# Altium schematic sheet EDA扩展板V3.0.SchDoc
size A2
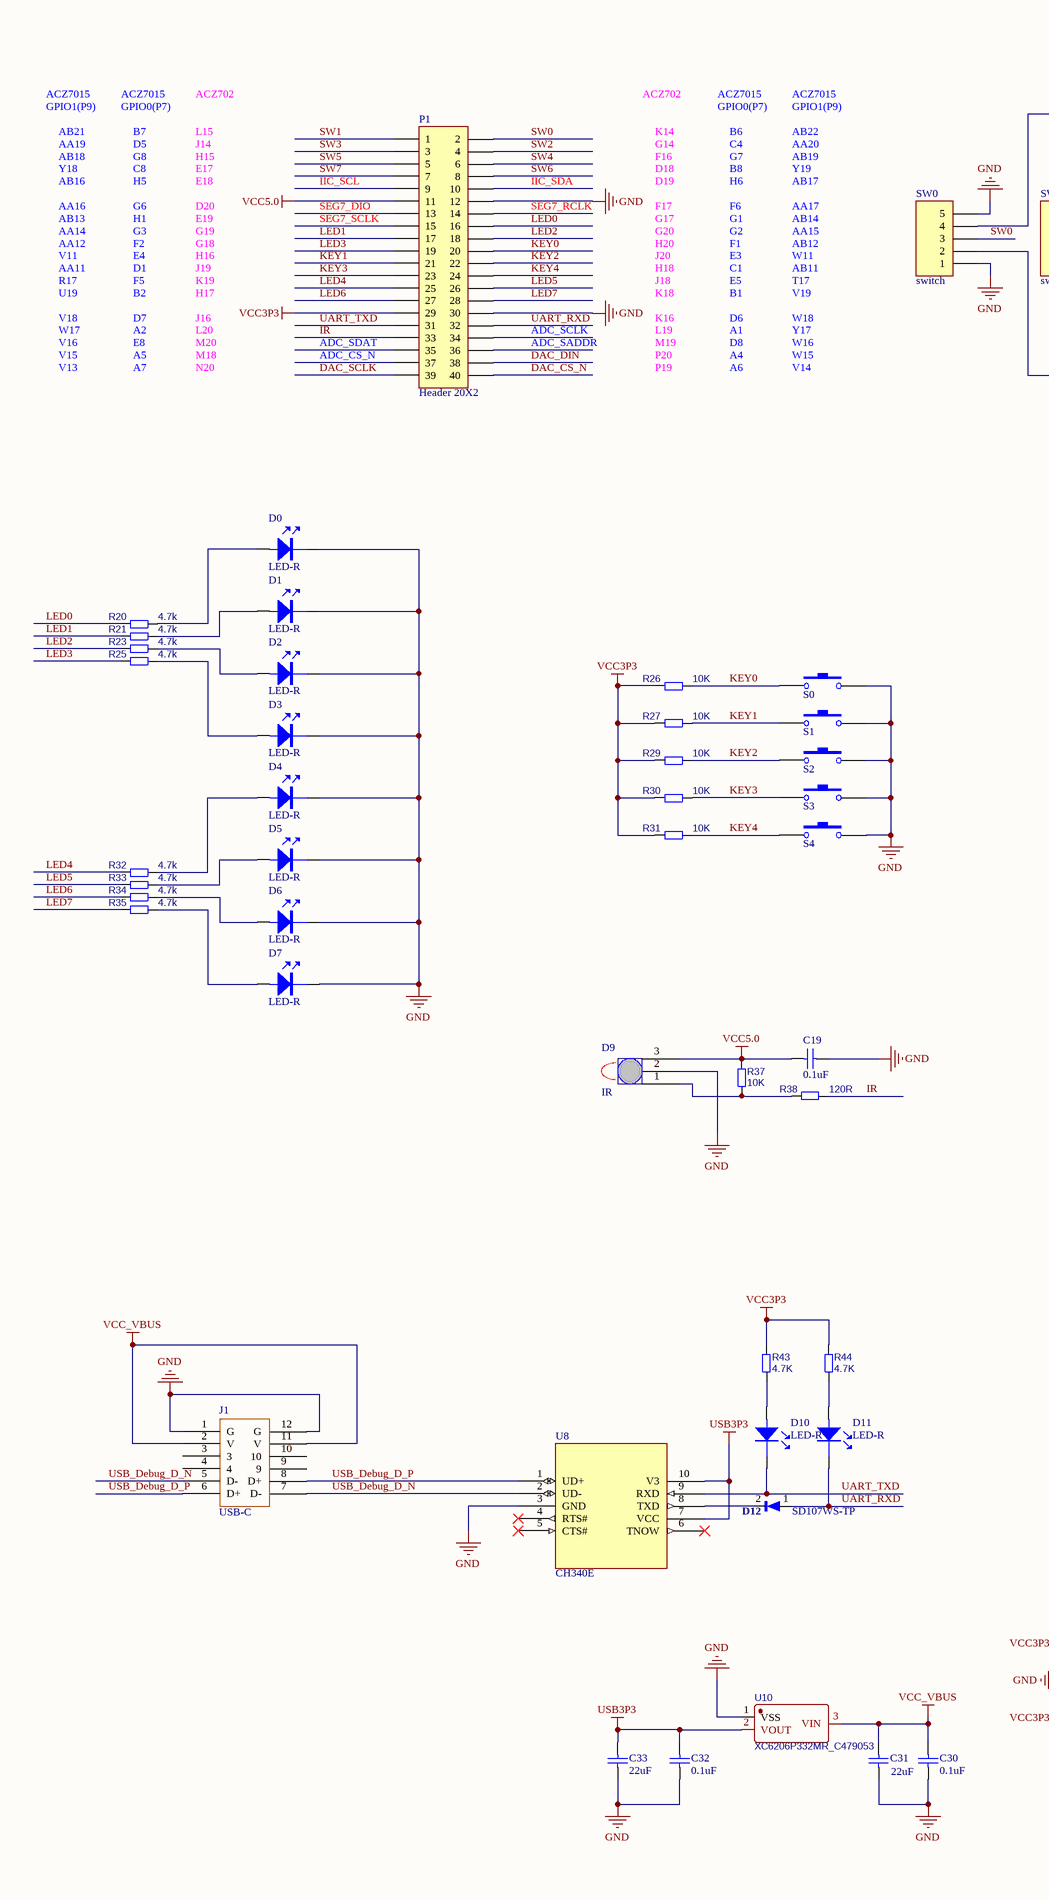
[diagram p0: EDA扩展板V3.0.SchDoc, left]
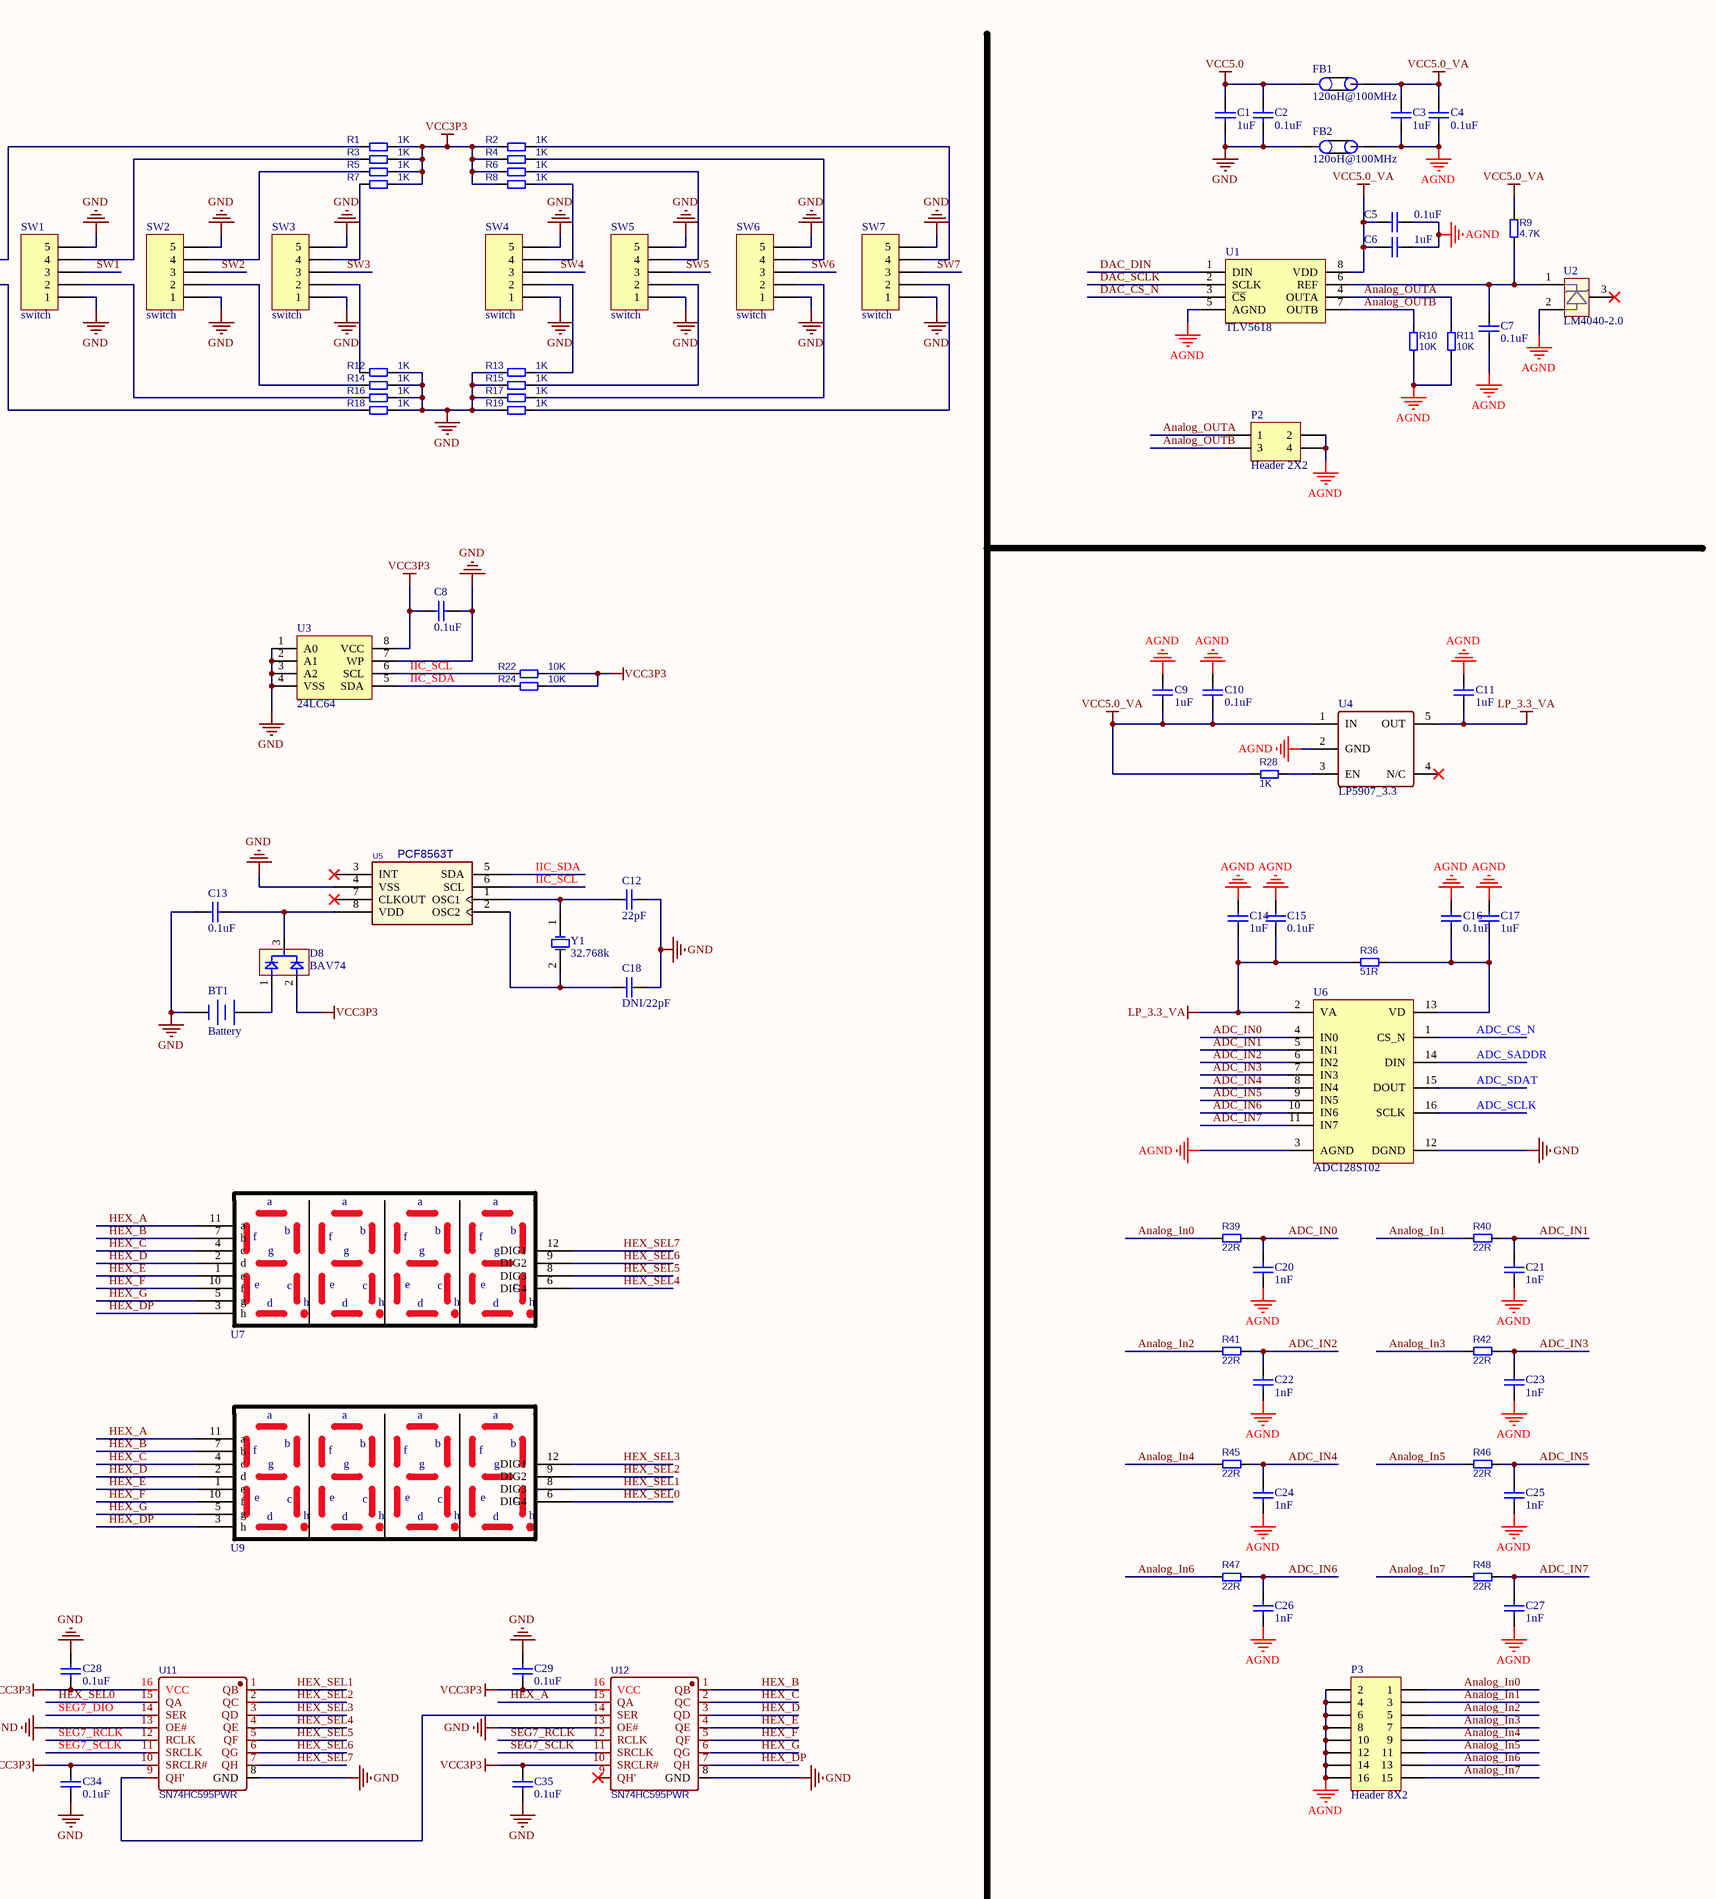
[diagram p1: EDA扩展板V3.0.SchDoc, right]

## Parts
BT1  Battery  [CR1220贴片电池座]
C1  1uF  [C0603]
C2  0.1uF  [C0603]
C3  1uF  [C0603]
C4  0.1uF  [C0603]
C5  0.1uF  [C0603]
C6  1uF  [C0603]
C7  0.1uF  [C0603]
C8  0.1uF  [C0603]
C9  1uF  [C0603]
C10  0.1uF  [C0603]
C11  1uF  [C0603]
C12  22pF  [C0603]
C13  0.1uF  [C0603]
C14  1uF  [C0603]
C15  0.1uF  [C0603]
C16  0.1uF  [C0603]
C17  1uF  [C0603]
C18  DNI/22pF  [C0603]
C19  0.1uF  [C0603]
C20  1nF  [C0603]
C21  1nF  [C0603]
C22  1nF  [C0603]
C23  1nF  [C0603]
C24  1nF  [C0603]
C25  1nF  [C0603]
C26  1nF  [C0603]
C27  1nF  [C0603]
C28  0.1uF  [C0603]
C29  0.1uF  [C0603]
C30  0.1uF  [C0603]
C31  22uF  [C0603]
C32  0.1uF  [C0603]
C33  22uF  [C0603]
C34  0.1uF  [C0603]
C35  0.1uF  [C0603]
D0  LED-R  [0603 LED]
D1  LED-R  [0603 LED]
D2  LED-R  [0603 LED]
D3  LED-R  [0603 LED]
D4  LED-R  [0603 LED]
D5  LED-R  [0603 LED]
D6  LED-R  [0603 LED]
D7  LED-R  [0603 LED]
D8  value BAV74  [SOT23]  (hidden comment: DIODE-D)
D9  IR  [HS-0038 圆头红外接收管]
D10  LED-R  [0603 LED]
D11  LED-R  [0603 LED]
D12  value SD107WS-TP  [SOD323]  (hidden comment: DIODE1)
FB1  120oH@100MHz  [L0603]
FB2  120oH@100MHz  [L0603]
J1  USB-C  [USB Type-c]
P1  Header 20X2  [HDR2X20]
P2  Header 2X2  [HDR2X2]
P3  Header 8X2  [HDR2X8]
R1  1K  [0603R]
R2  1K  [0603R]
R3  1K  [0603R]
R4  1K  [0603R]
R5  1K  [0603R]
R6  1K  [0603R]
R7  1K  [0603R]
R8  1K  [0603R]
R9  4.7K  [0603R]
R10  10K  [0603R]
R11  10K  [0603R]
R12  1K  [0603R]
R13  1K  [0603R]
R14  1K  [0603R]
R15  1K  [0603R]
R16  1K  [0603R]
R17  1K  [0603R]
R18  1K  [0603R]
R19  1K  [0603R]
R20  4.7k  [0603R]
R21  4.7k  [0603R]
R22  10K  [0603R]
R23  4.7k  [0603R]
R24  10K  [0603R]
R25  4.7k  [0603R]
R26  10K  [0603R]
R27  10K  [0603R]
R28  1K  [0603R]
R29  10K  [0603R]
R30  10K  [0603R]
R31  10K  [0603R]
R32  4.7k  [0603R]
R33  4.7k  [0603R]
R34  4.7k  [0603R]
R35  4.7k  [0603R]
R36  51R  [0603R]
R37  10K  [0603R]
R38  120R  [0603R]
R39  22R  [0603R]
R40  22R  [0603R]
R41  22R  [0603R]
R42  22R  [0603R]
R43  4.7K  [0603R]
R44  4.7K  [0603R]
R45  22R  [0603R]
R46  22R  [0603R]
R47  22R  [0603R]
R48  22R  [0603R]
S0  轻触开关  [SW-PB_3_6_4_3]  (value not drawn)
S1  轻触开关  [SW-PB_3_6_4_3]  (value not drawn)
S2  轻触开关  [SW-PB_3_6_4_3]  (value not drawn)
S3  轻触开关  [SW-PB_3_6_4_3]  (value not drawn)
S4  轻触开关  [SW-PB_3_6_4_3]  (value not drawn)
SW0  switch  [SW-1 X 2]
SW1  switch  [SW-1 X 2]
SW2  switch  [SW-1 X 2]
SW3  switch  [SW-1 X 2]
SW4  switch  [SW-1 X 2]
SW5  switch  [SW-1 X 2]
SW6  switch  [SW-1 X 2]
SW7  switch  [SW-1 X 2]
U1  TLV5618  [SOP-8-1]
U2  LM4040-2.0  [SOT23]
U3  24LC64  [SOP-8-1]
U4  LP5907_3.3  [LP5907]
U5  PCF8563T  [SOP-8-1]
U6  ADC128S102  [TSSOP-16]
U7  smg_6*8  [DIG4]  (value not drawn)
U8  CH340E  [msop-10]
U9  smg_6*8  [DIG4]  (value not drawn)
U10  XC6206P332MR_C479053  [SOT-23-3_L2.9-W1.6-P1.90-LS2.8-BR]
U11  SN74HC595PWR  [TSSOP-16_L5.0-W4.4-P0.65-LS6.4-BL]
U12  SN74HC595PWR  [TSSOP-16_L5.0-W4.4-P0.65-LS6.4-BL]
Y1  32.768k  [MC-146]

## Nets
AGND: C3.1 C4.1 C5.2 C6.2 C7.1 C9.1 C10.1 C11.1 C14.1 C15.1 C16.1 C17.1 C20.1 C21.1 C22.1 C23.1 C24.1 C25.1 C26.1 C27.1 FB2.2 P2.2 P2.4 P3.2 P3.4 P3.6 P3.8 P3.10 P3.12 P3.14 P3.16 R10.2 R11.2 U1.5(AGND) U2.2 U4.2(GND) U6.3(AGND)
GND: BT1.2(-) C1.1 C2.1 C8.2 C12.2 C13.1 C18.2 C19.2 C28.2 C29.2 C30.1 C31.1 C32.1 C33.1 C34.1 C35.1 D0.2 D1.2 D2.2 D3.2 D4.2 D5.2 D6.2 D7.2 D9.2(GND) FB2.1 J1.1(G) J1.12(G) P1.12 P1.30 R12.1 R13.2 R14.1 R15.2 R16.1 R17.2 R18.1 R19.2 S0.2 S1.2 S2.2 S3.2 S4.2 SW0.1 SW0.5 SW1.1 SW1.5 SW2.1 SW2.5 SW3.1 SW3.5 SW4.1 SW4.5 SW5.1 SW5.5 SW6.1 SW6.5 SW7.1 SW7.5 U3.1(A0) U3.2(A1) U3.3(A2) U3.4(VSS) U3.7(WP) U5.4(VSS) U6.12(DGND) U8.3(GND) U10.1(VSS) U11.8(GND) U11.13(OE#) U12.8(GND) U12.13(OE#)
LP_3.3_VA: C11.2 C14.2 C15.2 R36.1 U4.5(OUT) U6.2(VA)
USB3P3: C32.2 C33.2 U8.7(VCC) U8.10(V3) U10.2(VOUT)
VCC3P3: C8.1 C28.1 C29.1 C34.2 C35.2 D8.2(D2) P1.29 R1.1 R2.2 R3.1 R4.2 R5.1 R6.2 R7.1 R8.2 R22.1 R24.1 R26.2 R27.2 R29.2 R30.2 R31.2 R43.1 R44.1 U3.8(VCC) U11.10(SRCLR#) U11.16(VCC) U12.10(SRCLR#) U12.16(VCC)
VCC5.0: C1.2 C2.2 C19.1 D9.3(D) FB1.1 P1.11 R37.1
VCC5.0_VA: C3.2 C4.2 C5.1 C6.1 C9.2 C10.2 FB1.2 R9.1 R28.1 U1.8(VDD) U4.1(IN)
VCC_VBUS: C30.2 C31.2 J1.2(V) J1.11(V) U10.3(VIN)
ADC_CS_N: P1.37 U6.1(CS_N)
ADC_IN0: C20.2 R39.2 U6.4(IN0)
ADC_IN1: C21.2 R40.2 U6.5(IN1)
ADC_IN2: C22.2 R41.2 U6.6(IN2)
ADC_IN3: C23.2 R42.2 U6.7(IN3)
ADC_IN4: C24.2 R45.2 U6.8(IN4)
ADC_IN5: C25.2 R46.2 U6.9(IN5)
ADC_IN6: C26.2 R47.2 U6.10(IN6)
ADC_IN7: C27.2 R48.2 U6.11(IN7)
ADC_SADDR: P1.36 U6.14(DIN)
ADC_SCLK: P1.34 U6.16(SCLK)
ADC_SDAT: P1.35 U6.15(DOUT)
Analog_In0: P3.1 R39.1
Analog_In1: P3.3 R40.1
Analog_In2: P3.5 R41.1
Analog_In3: P3.7 R42.1
Analog_In4: P3.9 R45.1
Analog_In5: P3.11 R46.1
Analog_In6: P3.13 R47.1
Analog_In7: P3.15 R48.1
Analog_OUTA: P2.1 R11.1 U1.4(OUTA)
Analog_OUTB: P2.3 R10.1 U1.7(OUTB)
DAC_CS_N: P1.40 U1.3(~{CS})
DAC_DIN: P1.38 U1.1(DIN)
DAC_SCLK: P1.39 U1.2(SCLK)
HEX_A: U7.11(a) U9.11(a) U12.15(QA)
HEX_B: U7.7(b) U9.7(b) U12.1(QB)
HEX_C: U7.4(c) U9.4(c) U12.2(QC)
HEX_D: U7.2(d) U9.2(d) U12.3(QD)
HEX_DP: U7.3(h) U9.3(h) U12.7(QH)
HEX_E: U7.1(e) U9.1(e) U12.4(QE)
HEX_F: U7.10(f) U9.10(f) U12.5(QF)
HEX_G: U7.5(g) U9.5(g) U12.6(QG)
HEX_SEL0: U9.6(DIG4) U11.15(QA)
HEX_SEL1: U9.8(DIG3) U11.1(QB)
HEX_SEL2: U9.9(DIG2) U11.2(QC)
HEX_SEL3: U9.12(DIG1) U11.3(QD)
HEX_SEL4: U7.6(DIG4) U11.4(QE)
HEX_SEL5: U7.8(DIG3) U11.5(QF)
HEX_SEL6: U7.9(DIG2) U11.6(QG)
HEX_SEL7: U7.12(DIG1) U11.7(QH)
IIC_SCL: P1.9 R22.2 U3.6(SCL) U5.6(SCL)
IIC_SDA: P1.10 R24.2 U3.5(SDA) U5.5(SDA)
IR: P1.33 R38.2
KEY0: P1.20 R26.1 S0.1
KEY1: P1.21 R27.1 S1.1
KEY2: P1.22 R29.1 S2.1
KEY3: P1.23 R30.1 S3.1
KEY4: P1.24 R31.1 S4.1
LED0: P1.16 R20.2
LED1: P1.17 R21.2
LED2: P1.18 R23.2
LED3: P1.19 R25.2
LED4: P1.25 R32.2
LED5: P1.26 R33.2
LED6: P1.27 R34.2
LED7: P1.28 R35.2
SEG7_DIO: P1.13 U11.14(SER)
SEG7_RCLK: P1.14 U11.12(RCLK) U12.12(RCLK)
SEG7_SCLK: P1.15 U11.11(SRCLK) U12.11(SRCLK)
SW0: P1.2 SW0.3
SW1: P1.1 SW1.3
SW2: P1.4 SW2.3
SW3: P1.3 SW3.3
SW4: P1.6 SW4.3
SW5: P1.5 SW5.3
SW6: P1.8 SW6.3
SW7: P1.7 SW7.3
UART_RXD: D11.2 D12.1 P1.32
UART_TXD: D10.2 P1.31 U8.9(RXD)
USB_Debug_D_N: J1.5(D-) J1.7(D-) U8.2(UD-)
USB_Debug_D_P: J1.6(D+) J1.8(D+) U8.1(UD+)
NetBT1_1: BT1.1(+) D8.1(D1)
NetC7_2: C7.2 R9.2 U1.6(REF) U2.1(VDD)
NetC12_1: C12.1 U5.1(OSC1) Y1.1(OSC1)
NetC13_2: C13.2 D8.3(A) U5.8(VDD)
NetC16_2: C16.2 C17.2 R36.2 U6.13(VD)
NetC18_1: C18.1 U5.2(OSC2) Y1.2(OSC2)
NetD0_1: D0.1 R20.1
NetD1_1: D1.1 R21.1
NetD2_1: D2.1 R23.1
NetD3_1: D3.1 R25.1
NetD4_1: D4.1 R32.1
NetD5_1: D5.1 R33.1
NetD6_1: D6.1 R34.1
NetD7_1: D7.1 R35.1
NetD9_1: D9.1(VCC) R37.2 R38.1
NetD10_1: D10.1 R43.2
NetD11_1: D11.1 R44.2
NetD12_2: D12.2 U8.8(TXD)
NetR1_2: R1.2 SW0.4
NetR2_1: R2.1 SW7.4
NetR3_2: R3.2 SW1.4
NetR4_1: R4.1 SW6.4
NetR5_2: R5.2 SW2.4
NetR6_1: R6.1 SW5.4
NetR7_2: R7.2 SW3.4
NetR8_1: R8.1 SW4.4
NetR12_2: R12.2 SW3.2
NetR13_1: R13.1 SW4.2
NetR14_2: R14.2 SW2.2
NetR15_1: R15.1 SW5.2
NetR16_2: R16.2 SW1.2
NetR17_1: R17.1 SW6.2
NetR18_2: R18.2 SW0.2
NetR19_1: R19.1 SW7.2
NetR28_2: R28.2 U4.3(EN)
NetU11_9: U11.9(QH') U12.14(SER)

Not connected (* = marked no-connect by the designer): J1 3 4 9 10; U2 3*; U4 4(N/C)*; U5 3(INT)* 7(CLKOUT)*; U8 4(RTS#)* 5(CTS#)* 6(TNOW)*; U12 9(QH')*

## Notes on the sheet
- ACZ7015
- GPIO1(P9)
- AB21
- GPIO0(P7)
- B7
- L15
- ACZ702
- K14
- B6
- AB22
- AA19
- AB18
- Y18
- AB16
- D5
- G8
- C8
- H5
- J14
- H15
- E17
- E18
- G14
- F16
- D18
- D19
- C4
- G7
- B8
- H6
- AA20
- AB19
- Y19
- AB17
- AA16
- AB13
- AA14
- AA12
- V11
- G6
- H1
- G3
- F2
- E4
- D20
- E19
- G19
- G18
- H16
- F17
- G17
- G20
- H20
- J20
- F6
- G1
- G2
- F1
- E3
- AA17
- AB14
- AA15
- AB12
- W11
- V18
- AA11
- R17
- U19
- D7
- D1
- F5
- B2
- J19
- K19
- H17
- J16
- K16
- H18
- J18
- K18
- D6
- C1
- E5
- B1
- W18
- AB11
- T17
- V19
- W17
- V16
- V15
- V13
- A2
- E8
- A5
- A7
- L20
- M20
- M18
- N20
- L19
- M19
- P20
- P19
- A1
- D8
- A4
- A6
- Y17
- W16
- W15
- V14

## Library data of the parts
BT1 = Battery: Multicell Battery; Published: 24-Mar-1999; LatestRevisionDate: 17-Jul-2002; LatestRevisionNote: Re-released for DXP Platform.; PackageReference: BAT-2; Publisher: Altium Limited; PackageDescription: Battery; 2 Leads
C1-C35 = Cap1: Capacitor; Published: 8-Jun-2000; LatestRevisionDate: 17-Jul-2002; LatestRevisionNote: Re-released for DXP Platform.; PackageReference: RAD-0.3; Publisher: Altium Limited
  C1 C3 C6 C9 C11 C14 C17: Value: 1uF
  C2 C4 C5 C7 C8 C10 C13 C15 C16 C19 C28-C30 C32 C34 C35: Value: 0.1uF
  C12: Value: 22pF
  C18: Value: DNI/22pF
  C20-C27: Value: 1nF
  C31 C33: Value: 22uF
D0-D7 D10 D11 = LED_1: 贴片红色普亮二极管; Value: LED-R
D8 = 1.04.07.0013: BAV74,SOT-23,,RoHS; 名称: 双二极管; 设备封装名称: SOT-23_BAV74; 贴片和直插: SMT; 物料代码: 1.04.07.0013; 封装: SOT-23; RoHS: RoHS; 型号: BAV74; ComponentLink1Description: ErpDataInfo; ComponentLink1URL: http://erp.zlgmcu.com/ErpExt/ErpData/ListMateriel.aspx?pkey=1.04.07.0013
D9 = IR: 红外接收头
D12 = 1.04.07.0027_1: 1N4148,SOD-323,RoHS; 名称: 二极管; 设备封装名称: SOD-323_1N4148; 贴片和直插: SMT; 物料代码: 1.04.07.0027; 封装: SOD-323; RoHS: RoHS; 型号: 1N4148; ComponentLink1Description: ErpDataInfo; ComponentLink1URL: http://erp.zlgmcu.com/ErpExt/ErpData/ListMateriel.aspx?pkey=1.04.07.0027
FB1 FB2 = CiZhu: Value: 120oH@100MHz
J1 = USB-C-16
P1 = Header 20X2_1: IDC3-40，2.54mm，双排2*20简牛; LatestRevisionDate: 17-Jul-2002; LatestRevisionNote: Re-released for DXP Platform.; Publisher: Altium Limited
P2 = Header 2X2: Header, 2-Pin, Dual row; LatestRevisionDate: 17-Jul-2002; LatestRevisionNote: Re-released for DXP Platform.; Publisher: Altium Limited
P3 = Header 8X2: Header, 8-Pin, Dual row; LatestRevisionDate: 17-Jul-2002; LatestRevisionNote: Re-released for DXP Platform.; Publisher: Altium Limited
R1-R48 = R: Value: DNI/4K7
S0-S4 = SW-PB: Switch; Manufacturer: Generic Components; Published: 1999
SW0-SW7 = Header 5: Header, 5-Pin; LatestRevisionDate: 17-Jul-2002; LatestRevisionNote: Re-released for DXP Platform.; Publisher: Altium Limited
U2 = LM4040
U3 = 24LC256
U4 = LP5907
U5 = PCF8563: Part Number: TMP-13; ICA_PARTNUM: $$2098133$$DS1302S; ICA_MFR_NAME: MAXIM INTEGRATED PRODUCTS INC
U6 = ADC128S022
U8 = CH340E: USB to TTL Serial / UART
U10 = XC6206P332MR_C479053_1: BOM_Manufacturer: PUOLOP; Contributor: LCSC; BOM_Supplier: LCSC; BOM_Supplier Part: C479053; BOM_Manufacturer Part: XC6206P332MR; BOM_JLCPCB Part Class: Extended Part; spicePre: U; spiceSymbolName: XC6206P332MR_C479053
U11 U12 = SN74HC595PWR: BOM_Manufacturer: Texas Instruments; Contributor: LCSC; BOM_Supplier: LCSC; BOM_Supplier Part: C273642; BOM_Manufacturer Part: SN74HC595PWR; BOM_JLCPCB Part Class: Extended Part; spicePre: U; spiceSymbolName: SN74HC595PWR
Y1 = XATL: Value: 32.768k